# Altium schematic sheet FlashMemory_Section.SchDoc
size A4; SheetNumber: 4; SheetTotal: 8
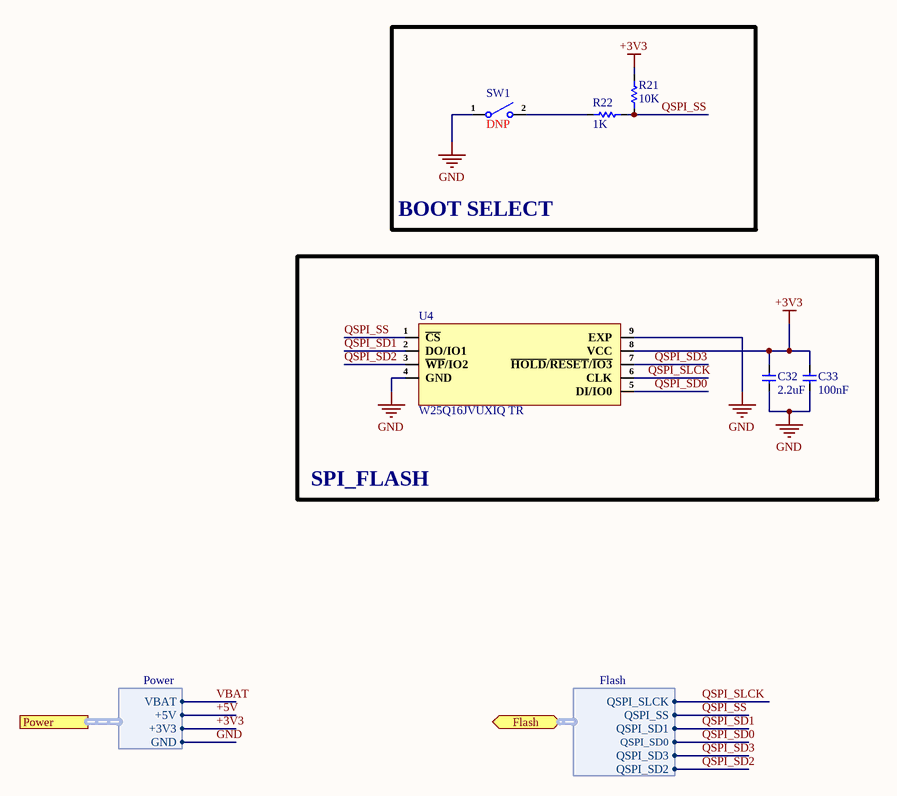
[diagram p0: FlashMemory_Section.SchDoc]

## Parts
C32  2.2uF  [Cap-0402]
C33  100nF  [cap-0402]
R21  10K  [Res-0402]
R22  1K  [Res-0402]
SW1  DNP  [EVQ-P7J01P]
U4  W25Q16JVUXIQ TR  [8-USON (2x3)]

## Blocks framed on the sheet
BOOT SELECT: R21 R22 SW1
SPI_FLASH: C32 C33 U4

## Ports
Flash (bidir, harness Flash, see Top-Sheet[3A], Controller_Section[3D]), Power (harness Power, see Top-Sheet[3A], Connector_Section[4D], Controller_Section[2D], Power_Section[3D], RTC_Section[2D], USB HUB_Section[1D], WiFiModule_Section[2D])

## Harnesses
Flash: QSPI_SLCK, QSPI_SS, QSPI_SD1, QSPI_SD3, QSPI_SD0, QSPI_SD2
Power: +5V, +3V3, GND, VBAT

## Nets
+3V3: C32.2 C33.2 R21.2 U4.8(VCC) ; port Power.+3V3
GND: C32.1 C33.1 SW1.1 U4.4(GND) U4.9(EXP) ; port Power.GND
+5V: port Power.+5V
QSPI_SD0: U4.5(DI/IO0) ; port Flash.QSPI_SD0
QSPI_SD1: U4.2(DO/IO1) ; port Flash.QSPI_SD1
QSPI_SD2: U4.3(~{WP}/IO2) ; port Flash.QSPI_SD2
QSPI_SD3: U4.7(~{HOLD}/~{RESET}/~{IO3}) ; port Flash.QSPI_SD3
QSPI_SLCK: U4.6(CLK) ; port Flash.QSPI_SLCK
QSPI_SS: R21.1 R22.2 U4.1(~{CS}) ; port Flash.QSPI_SS
VBAT: port Power.VBAT
NetR22_1: R22.1 SW1.2

## Notes on the sheet
- File:
- Title:
- Date:
- Page
- Num:
- Total:
- Drawn By: Huzaifa Ali

## Library data of the parts
C32 = GRM155R61E225KE11D: CAP CER 2.2UF 25V X5R 0402; Manufacturer: Murata; Material: Ceramic; Tolerance: 10%; Item Type: Capacitor; Supplier 1: Avnet; Manufacturer Part Number: GRM155R61E225KE11D; RoHS: Yes; Category: Ceramic Capacitors; Stock 1: 210000; Pricing 1: 10000=0.03830, 20000=0.03623, 40000=0.03416, 60000=0.03209, 80000=0.03002, 100000=0.02795, 1000000=0.02588 (USD); Mount: Surface Mount; Case/Package: 0402; Case Code (Metric): 1005; Case Code (Imperial): 0402; Weight: 0.000212oz; Min Operating Temperature: -55°C; Max Operating Temperature: 85°C; Dielectric: X5R; Capacitance: 2.2uF; Packaging: Tape and Reel; Voltage Rating: 25V; Termination: SMD/SMT; Resistor Type: Ceramic; Voltage Rating (DC): 25V; Package Quantity: 10000; Length: 1mm; Width: 0.5mm; Height: 0.5mm; Thickness: 0.022inch; Lead Free: Lead Free; RoHS Compliant: Yes; ComponentLink1URL: http://www.mouser.com/ds/2/281/c02e-2905.pdf?src-supplier=Mouser; ComponentLink1Description: http://www.mouser.com/ds/2/281/c02e-2905.pdf?src-supplier=Mouser; ComponentLink2URL: http://search.murata.co.jp/Ceramy/image/img/A01X/G101/ENG/GRM155R61E225KE11-01.pdf?src-supplier=Digi-Key; ComponentLink2Description: http://search.murata.co.jp/Ceramy/image/img/A01X/G101/ENG/GRM155R61E225KE11-01.pdf?src-supplier=Digi-Key; ComponentLink3URL: http://search.murata.co.jp/Ceramy/image/img/A01X/partnumbering_e_01.pdf?src-supplier=Digi-Key; ComponentLink3Description: http://search.murata.co.jp/Ceramy/image/img/A01X/partnumbering_e_01.pdf?src-supplier=Digi-Key; ComponentLink4URL: http://psearch.en.murata.com/capacitor/product/GRM155R61E225KE11%23.pdf?src-supplier=Avnet; ComponentLink4Description: http://psearch.en.murata.com/capacitor/product/GRM155R61E225KE11%23.pdf?src-supplier=Avnet; Supplier Part Number 1: GRM155R61E225KE11D; LCSC Part Number: C385032
C33 = C1005X7R1H104KT000F: CAP CER 0.1UF 50V X7R 0402; Manufacturer: TDK; Tolerance: 10%; Voltage: 25V; Item Type: Capacitor; Supplier 1: Avnet; Manufacturer Part Number: C1005X7R1H104KT000F; RoHS: No; Category: Ceramic Capacitors; Dielectric: X7R; Supplier Part Number 1: C1005X7R1H104KT000F; LCSC Part Number: C361198; ComponentLink1Description: LCSC; ComponentLink1URL: https://www.lcsc.com/product-detail/Multilayer-Ceramic-Capacitors-MLCC-SMD-SMT_TDK-C1005X7R1H104KT000F_C361198.html
R21 = RC0402FR-0710KL: RES 10K OHM 1% 1/16W 0402; Manufacturer: Yageo; Resistance: 10kR; Voltage Rating (DC): 50V; Temperature Coefficient: 100ppm/°C; Power Rating: 62.5mW; Max Power Dissipation: 63mW; Item Type: Resistor; Supplier 1: Mouser; Manufacturer Part Number: RC0402FR-0710KL; RoHS: Yes; Category: Chip SMD Resistors; Stock 1: 18648329; Pricing 1: 1=0.10000, 10=0.01400, 50=0.01400, 100=0.00500, 1000=0.00300, 10000=0.00200 (USD); Case/Package: 0402; Number of Pins: 2; Case Code (Imperial): 0402; Case Code (Metric): 1005; Min Operating Temperature: -55°C; Max Operating Temperature: 155°C; Resistor Type: Thick Film; Tolerance: 1%; Packaging: Tape and Reel; Voltage Rating: 50V; Termination: SMD/SMT; Working Voltage: 50V; Number of Terminations: 2; Features: Moisture Resistant; Series: RC; Resistance Tolerance: 1%; Construction: Rectangular; Length: 1mm; Width: 0.5mm; Height: 0.32mm; Depth: 0.5mm; Lead Pitch: 0.2mm; REACH SVHC: No SVHC; Lead Free: Lead Free; RoHS Compliant: Yes; Military Standard: Not; ComponentLink1URL: https://datasheet.ciiva.com/7660/38568-7660787.pdf?src-supplier=Element14; ComponentLink1Description: https://datasheet.ciiva.com/7660/38568-7660787.pdf?src-supplier=Element14; ComponentLink2URL: https://datasheet.ciiva.com/7849/1686128-7849814.pdf?src-supplier=Element14; ComponentLink2Description: https://datasheet.ciiva.com/7849/1686128-7849814.pdf?src-supplier=Element14; ComponentLink3URL: https://datasheet.ciiva.com/7983/1018594-7983486.pdf?src-supplier=Element14; ComponentLink3Description: https://datasheet.ciiva.com/7983/1018594-7983486.pdf?src-supplier=Element14; ComponentLink4URL: https://datasheet.ciiva.com/22747/1018594-22747512.pdf?src-supplier=Element14; ComponentLink4Description: https://datasheet.ciiva.com/22747/1018594-22747512.pdf?src-supplier=Element14; ComponentLink5URL: https://datasheet.ciiva.com/12667/pyu-rc0402-51-rohs-l-6-r-12667067.pdf?src-supplier=Mouser; ComponentLink5Description: https://datasheet.ciiva.com/12667/pyu-rc0402-51-rohs-l-6-r-12667067.pdf?src-supplier=Mouser; ComponentLink6URL: https://datasheet.ciiva.com/7849/1784430-7849813.pdf?src-supplier=Element14; ComponentLink6Description: https://datasheet.ciiva.com/7849/1784430-7849813.pdf?src-supplier=Element14; ComponentLink7URL: https://datasheet.ciiva.com/7849/1784430-7849815.pdf?src-supplier=Element14; ComponentLink7Description: https://datasheet.ciiva.com/7849/1784430-7849815.pdf?src-supplier=Element14; Supplier Part Number 1: 603-RC0402FR-0710KL; LCSC Part Number: C60490
R22 = CRCW04021K00FKEDHP: RES SMD 1K OHM 1% 1/5W 0402; Manufacturer: Vishay Dale; Resistance: 1kR; Temperature Coefficient: 100ppm/°C; Power Rating: 125mW; Voltage Rating: 50V; Supplier 1: Digi-Key; Manufacturer Part Number: CRCW04021K00FKEDHP; Stock 1: 315989; Pricing 1: 1=0.15, 10=0.132, 100=0.0506, 1000=0.02226, 2500=0.01923, 5000=0.0172 (USD); Mount: Surface Mount; Case/Package: 0402; Number of Pins: 2; Contact Plating: Tin; Weight: 2.3E-05oz; Case Code (Imperial): 0402; Case Code (Metric): 1005; Size Code: 0402; Min Operating Temperature: -55°C; Max Operating Temperature: 155°C; Tolerance: 1%; Resistor Type: Thick Film; Package Quantity: 10; Packaging: Tape and Reel; Number of Terminations: 2; Termination: SMD/SMT; Max Power Dissipation: 125mW; Voltage Rating (DC): 50V; Features: Automotive AEC-Q200; Series: CRCW-HP; Construction: Rectangular; Technology: THICK FILM; Resistance Tolerance: 1%; Length: 1mm; Width: 0.5mm; Height: 0.3mm; Depth: 0.5mm; Radiation Hardening: No; REACH SVHC: Unknown; Military Standard: Not; Lead Free: Lead Free; RoHS Compliant: Yes; ComponentLink1URL: http://www.farnell.com/datasheets/2339608.pdf?src-supplier=Element14; ComponentLink1Description: http://www.farnell.com/datasheets/2339608.pdf?src-supplier=Element14; ComponentLink2URL: http://www.vishay.com/docs/20043/crcwhpe3.pdf?src-supplier=Digi-Key; ComponentLink2Description: http://www.vishay.com/docs/20043/crcwhpe3.pdf?src-supplier=Digi-Key; ComponentLink3URL: http://www.mouser.com/ds/2/427/crcwhpe3-46056.pdf?src-supplier=Mouser; ComponentLink3Description: http://www.mouser.com/ds/2/427/crcwhpe3-46056.pdf?src-supplier=Mouser; ComponentLink4URL: http://www.vishay.com/docs/20043/crcwhpe3.pdf?src-supplier=Avnet; ComponentLink4Description: http://www.vishay.com/docs/20043/crcwhpe3.pdf?src-supplier=Avnet; ComponentLink5URL: http://www.vishay.com/docs/20043/crcwhpe3.pdf?src-supplier=Future+Electronics; ComponentLink5Description: http://www.vishay.com/docs/20043/crcwhpe3.pdf?src-supplier=Future+Electronics; Supplier Part Number 1: 541-1.00KYCT-ND; LCSC Part Number: C313354
SW1 = EVQ-P7J01P: SWITCH TACTILE SPST-NO 0.05A 12V; Manufacturer: Panasonic; Mechanical Life: 100000Cycles; Actuator Color: Black; Operating Force: 1.6N; Current Rating: 50mA; Throw Configuration: SPST; Contact Resistance: 500mR; Illumination Type: Non-Illuminated; Switch Travel: 0.2mm; Switch Function: Off-Mom; Actuator Length: 0.65mm; Supplier: Mouser; Supplier Part Number: 667-EVQP7J01P; Manufacturer Part Number: EVQ-P7J01P; RoHS: Yes; Category: Tactile Switches; Stock: 9778; Pricing: 1=0.28, 10=0.252, 50=0.252, 100=0.217, 1000=0.173, 10000=0.148 (USD); Mounting Technology: Surface Mount; Case/Package: SMD/SMT; Min Operating Temperature: -20°C; Max Operating Temperature: 70°C; Package Quantity: 5000; Packaging: Tape and Reel; Voltage Rating (DC): 12V; Max Voltage Rating (DC): 12V; Termination: Gull Wing; Contact Current Rating: 50mA; Electrical Life: 100000Cycles; Orientation: Right Angle; Series: EVQP7; Length: 3.5mm; Width: 2.9mm; Height: 1.35mm; Radiation Hardening: No; Reach SVHC Compliant: No; Lead Free: Lead Free; RoHS Compliant: Yes; ComponentLink1URL: https://datasheet.ciiva.com/24076/atv0000ce4-259034-24076561.pdf?src-supplier=Mouser; ComponentLink1Description: https://datasheet.ciiva.com/24076/atv0000ce4-259034-24076561.pdf?src-supplier=Mouser; ComponentLink2URL: https://datasheet.ciiva.com/22777/atk0000ce20-22777575.pdf?src-supplier=Farnell; ComponentLink2Description: https://datasheet.ciiva.com/22777/atk0000ce20-22777575.pdf?src-supplier=Farnell; ComponentLink3URL: https://datasheet.ciiva.com/29974/atk0000ce20-29974069.pdf?src-supplier=Avnet; ComponentLink3Description: https://datasheet.ciiva.com/29974/atk0000ce20-29974069.pdf?src-supplier=Avnet; ComponentLink4URL: https://datasheet.ciiva.com/30252/atk0000ce20-30252044.pdf?src-supplier=Onlinecomponents.com; ComponentLink4Description: https://datasheet.ciiva.com/30252/atk0000ce20-30252044.pdf?src-supplier=Onlinecomponents.com; Item Type: SWITCH
U4 = W25Q16JVUXIQ TR: IC FLASH 16MBIT SPI/QUAD 8USON; Manufacturer: Winbond; Supplier: Digi-Key; Supplier Part Number: 256-W25Q16JVUXIQTRCT-ND; Manufacturer Part Number: W25Q16JVUXIQ TR; RoHS: No; Category: Memory; Stock: 47295; Pricing: 1=0.56, 10=0.51, 25=0.504, 50=0.501, 100=0.4479, 250=0.44416, 500=0.43758, 1000=0.42193 (USD)